# Altium project 5PB1214CMGK8.PrjPcb
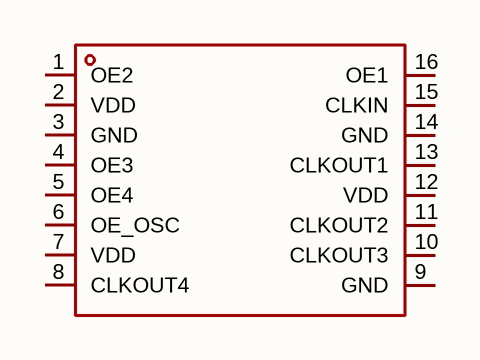
[diagram p0: 5PB1214CMGK8.schdoc]
1 sheet, 1 parts. Net scope: global (net labels, ports and power ports of the same name join across sheets).

## Sheet 5PB1214CMGK8.schdoc
size 127 x 101 mm

### Parts
U?  5pb1214cmgk8  [QFN-16_L2.5-W2.5-P0.40-TL-A]  (value not drawn)

### Nets

Not connected (* = marked no-connect by the designer): U? 1(OE2) 2(VDD) 3(GND) 4(OE3) 5(OE4) 6(OE_OSC) 7(VDD) 8(CLKOUT4) 9(GND) 10(CLKOUT3) 11(CLKOUT2) 12(VDD) 13(CLKOUT1) 14(GND) 15(CLKIN) 16(OE1)

### Library data of the parts
U? = 5pb1214cmgk8: 最大输出频率:200MHz;输出通道数:4;工作电压:2.375V~2.625V；1.71V~1.89V；3.135V~3.465V;; Manufacturer: RENESAS(瑞萨)/IDT; AddInBom: yes; ModelId: 8988433fa6844d57aec74569e95208a8; ModelTransform: 98.504,98.504,0,0,0,0,-0.001,0.001,0; Output Frequency(Max): 200MHz; Number of Inputs: 1; Number of outputs: 4; Symbol: 5PB1214CMGK8; LCSC Part Name: 高性能温补晶体振荡器（TCXO）/低压CMOS时钟缓冲器系列; SupplierPart: C3613412; ManufacturerPart: 5PB1214CMGK8; Supplier Footprint: QFN-16(2.5x2.5); JLCPCB Part Class: Extended Part; Datasheet: https://item.szlcsc.com/datasheet/5PB1214CMGK8/4180144.html; Supplier: LCSC; ConvertToPcb: yes; FootprintName: QFN-16_L2.5-W2.5-P0.40-TL-A; ModelName: QFN-16_L2.5-W2.5-P0.40-TL-A; Voltage - Supply: 2.375V~2.625V；1.71V~1.89V；3.135V~3.465V; Output Skew: -; Operating Temperature: -40℃~+105℃